# Altium schematic sheet Sensor-Sheet.SchDoc
size A4; SheetNumber: 4; SheetTotal: 5
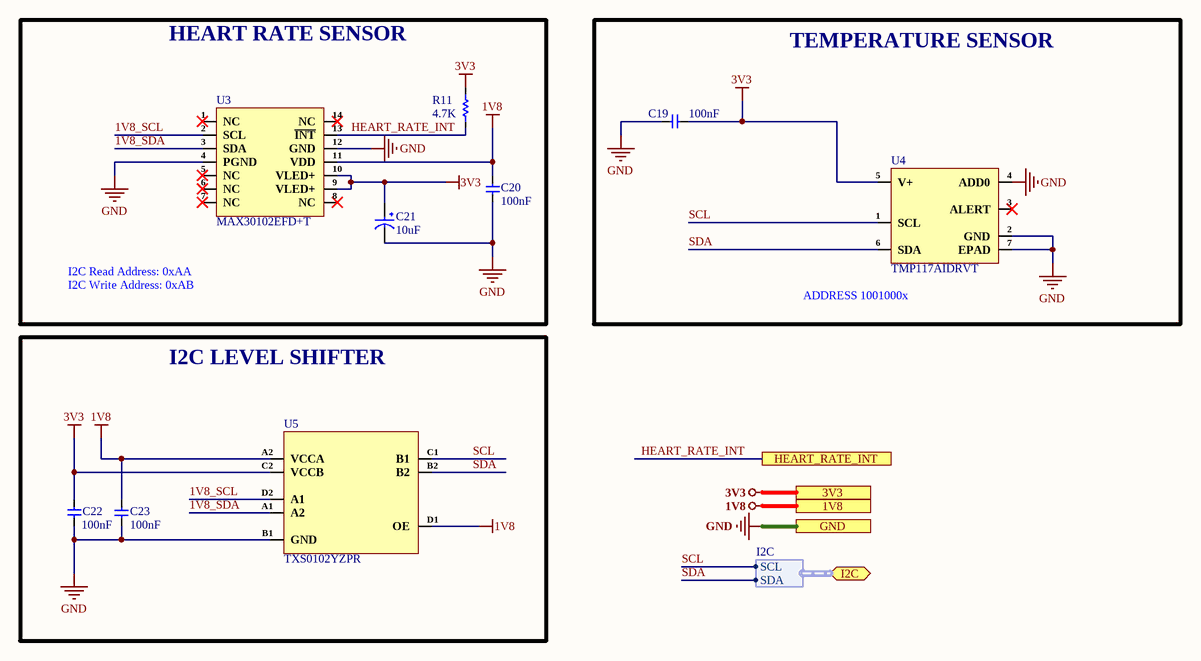
[diagram p0: Sensor-Sheet.SchDoc]

## Parts
C19  100nF  [CAP-0201]
C20  100nF  [CAP-0201]
C21  10uF  [Tant-0603]
C22  100nF  [CAP-0201]
C23  100nF  [CAP-0201]
R11  4.7K  [Res-0201]
U3  MAX30102EFD+T  [MAX30102EFD+T]
U4  TMP117AIDRVT  [WSON-6(2x2)]
U5  TXS0102YZPR  [8-DSBGA]

## Blocks framed on the sheet
HEART RATE SENSOR: C20 C21 R11 U3
TEMPERATURE SENSOR: C19 U4
I2C LEVEL SHIFTER: C22 C23 U5

## Ports
1V8 (see Top-Sheet[3B], Power-Sheet[2D]), 3V3 (see Top-Sheet[3B], Controller-Sheet[3D], Display-Sheet[3D], Power-Sheet[2D]), GND (see Top-Sheet[3B], Controller-Sheet[3D], Display-Sheet[3D], Power-Sheet[2D]), HEART_RATE_INT (see Top-Sheet[3B], Controller-Sheet[3D]), I2C (bidir, harness I2C, see Top-Sheet[3B], Controller-Sheet[1D], Power-Sheet[1D])

## Harnesses
I2C: SCL, SDA

## Nets
1V8: C20.2 C23.2 U3.11(VDD) U5.A2(VCCA) U5.D1(OE) ; port 1V8
3V3: C19.1 C21.1 C22.1 R11.2 U3.9(VLED+) U3.10(VLED+) U4.5(V+) U5.C2(VCCB) ; port 3V3
GND: C19.2 C20.1 C21.2 C22.2 C23.1 U3.4(PGND) U3.12(GND) U4.2(GND) U4.4(ADD0) U4.7(EPAD) U5.B1(GND) ; port GND
1V8_SCL: U3.2(SCL) U5.D2(A1)
1V8_SDA: U3.3(SDA) U5.A1(A2)
HEART_RATE_INT: R11.1 U3.13(~{INT}) ; port HEART_RATE_INT
SCL: U4.1(SCL) U5.C1(B1) ; port I2C.SCL
SDA: U4.6(SDA) U5.B2 ; port I2C.SDA

Not connected (* = marked no-connect by the designer): U3 1(NC)* 5(NC)* 6(NC)* 7(NC)* 8(NC)* 14(NC)*; U4 3(ALERT)*

## Notes on the sheet
- I2C Read Address: 0xAA
  I2C Write Address: 0xAB
- (near U4) ADDRESS 1001000x
- File:
- Title:
- Date:
- Page
- Num:
- Total:
- Drawn By: Huzaifa Ali

## Library data of the parts
C19 C20 C22 C23 = CC0201KRX5R6BB104: CAP CER 0.1UF 10V X5R 0201; Manufacturer: Yageo; Tolerance: 10%; Supplier 1: Mouser; Manufacturer Part Number: CC0201KRX5R6BB104; RoHS: Yes; Category: Ceramic Capacitors; Stock 1: 824403; Pricing 1: 1=0.10000, 10=0.02400, 50=0.02400, 100=0.01900, 1000=0.01100, 10000=0.00900 (USD); Mount: Surface Mount; Case/Package: 0201; Case Code (Imperial): 0201; Case Code (Metric): 0603; Weight: 6E-06oz; Min Operating Temperature: -55°C; Max Operating Temperature: 85°C; Capacitance: 100nF; Dielectric: X5R; Voltage Rating (DC): 10V; Packaging: Tape and Reel; Termination: SMD/SMT; Resistor Type: Ceramic; Voltage Rating: 10V; Series: CC; Construction: Flat; Length: 0.6mm; Width: 0.012inch; Height: 0.3mm; Thickness: 0.013inch; Depth: 0.3mm; Radiation Hardening: No; Lead Free: Lead Free; Halogen Free: Halogen Free; RoHS Compliant: Yes; ComponentLink1URL: https://datasheet.ciiva.com/11587/upy-gphc-x5r-4v-to-50v-12-11587190.pdf?src-supplier=Avnet; ComponentLink1Description: https://datasheet.ciiva.com/11587/upy-gphc-x5r-4v-to-50v-12-11587190.pdf?src-supplier=Avnet; Supplier Part Number 1: 603-CC201KRX5R6BB104; LCSC Part Number: C190183
C21 = T58MM106M6R3C0300: CAP TANT POLY 10UF 6.3V 0603; Manufacturer: Vishay; ESR (Equivalent Series Resistance): 300mR; Tolerance: 20%; Item Type: Capacitor; Supplier: Digi-Key; Supplier Part Number: 718-2111-1-ND; Manufacturer Part Number: T58MM106M6R3C0300; RoHS: Yes; Category: Tantalum Capacitors; Stock: 738; Pricing: 1=0.69, 10=0.462, 50=0.3676, 100=0.3035, 500=0.23714, 1000=0.20158 (USD); Mounting Technology: Surface Mount; Case/Package: 0603; Case Code (Metric): 1608; Case Code (Imperial): 0603; Min Operating Temperature: -55°C; Max Operating Temperature: 105°C; Packaging: Cut Tape; Value: 10uF; Voltage Rating: 6.3V; Voltage Rating (DC): 6.3V; Features: General Purpose; Series: vPolyTan™ T58; Construction: Flat; Length: 1.6mm; Depth: 0.85mm; RoHS Compliant: Yes; Reach SVHC Compliant: Unknown; ComponentLink1URL: http://www.farnell.com/datasheets/2699706.pdf?src-supplier=Farnell; ComponentLink1Description: http://www.farnell.com/datasheets/2699706.pdf?src-supplier=Farnell; ComponentLink2URL: http://www.vishay.com/docs/40189/t58.pdf?src-supplier=Avnet; ComponentLink2Description: http://www.vishay.com/docs/40189/t58.pdf?src-supplier=Avnet; ComponentLink3URL: http://www.farnell.com/datasheets/2028130.pdf?src-supplier=Element14; ComponentLink3Description: http://www.farnell.com/datasheets/2028130.pdf?src-supplier=Element14; ComponentLink4URL: http://www.vishay.com/docs/40189/t58.pdf?src-supplier=Digi-Key; ComponentLink4Description: http://www.vishay.com/docs/40189/t58.pdf?src-supplier=Digi-Key; LCSC Part Number: C2158420
R11 = RC0201FR-074K7L: RES 4.7K OHM 1% 1/20W 0201; Manufacturer: Yageo; Item Type: Resistor; Supplier: Future Electronics; Supplier Part Number: 7537285; Manufacturer Part Number: RC0201FR-074K7L; RoHS: Yes; Category: Chip SMD Resistors; Stock: 1610000; Pricing: 10000=0.0014, 50000=0.0013, 250000=0.0013, 750000=0.0012, 2000000=0.0011 (USD); ComponentLink1URL: https://datasheet.ciiva.com/2493/pyu-r-int-thick-7-2493811.pdf?src-supplier=Digi-Key; ComponentLink1Description: https://datasheet.ciiva.com/2493/pyu-r-int-thick-7-2493811.pdf?src-supplier=Digi-Key; ComponentLink2URL: https://datasheet.ciiva.com/2493/pyu-r-int-thick-7-2493812.pdf?src-supplier=Digi-Key; ComponentLink2Description: https://datasheet.ciiva.com/2493/pyu-r-int-thick-7-2493812.pdf?src-supplier=Digi-Key; ComponentLink3URL: https://datasheet.ciiva.com/2493/pyu-r-int-thick-7-2493813.pdf?src-supplier=Digi-Key; ComponentLink3Description: https://datasheet.ciiva.com/2493/pyu-r-int-thick-7-2493813.pdf?src-supplier=Digi-Key; ComponentLink4URL: https://datasheet.ciiva.com/8892/pyu-rc0201-51-rohs-l-8-8892942.pdf?src-supplier=Avnet; ComponentLink4Description: https://datasheet.ciiva.com/8892/pyu-rc0201-51-rohs-l-8-8892942.pdf?src-supplier=Avnet; ComponentLink5URL: https://datasheet.ciiva.com/7672/1563626-7672233.pdf?src-supplier=Element14; ComponentLink5Description: https://datasheet.ciiva.com/7672/1563626-7672233.pdf?src-supplier=Element14; LCSC Part Number: C138135
U3 = MAX30102EFD+T: SENSOR OXIMETER/HEART RATE I2C; Manufacturer: Maxim; Item Type: Heart Rate Sensor; Supplier: Mouser; Supplier Part Number: 700-MAX30102EFD+T; Manufacturer Part Number: MAX30102EFD+T; RoHS: Yes; Category: Sensors; Stock: 7965; Pricing: 1=12.43, 10=9.84, 50=9.32, 100=7.95, 1000=7.05, 10000=6.66 (USD); Min Operating Temperature: -40°C; Max Operating Temperature: 85°C; Output Type: I2C; Series: -; Packaging: Cut Tape; RoHS Compliant: Yes; ComponentLink1URL: https://datasheets.maximintegrated.com/en/ds/MAX30102.pdf?src-supplier=Digi-Key; ComponentLink1Description: https://datasheets.maximintegrated.com/en/ds/MAX30102.pdf?src-supplier=Digi-Key; LCSC Part Number: C6454833
U4 = TMP117AIDRVT: WSON-6(2x2) Temperature Sensors ROHS; Manufacturer: Texas Instruments; Output Type: I2C; Resolution: 16b; Manufacturer Part Number: TMP117AIDRVT; Package: WSON-6(2x2); LCSC Part Number: C2871850; Item Type: Temperature Sensor; ComponentLink1Description: LCSC; Supplier: Mouser; Supplier Part Number: 595-TMP117AIDRVT; RoHS: Yes; Category: Integrated Circuits (ICs); Stock: 14532; Pricing: 1=6.97, 10=5.24, 50=5.24, 100=4.61, 1000=4.02, 10000=4.02 (USD); Mounting Technology: Surface Mount; Min Operating Temperature: -55°C; Max Operating Temperature: 150°C; Packaging: Cut Tape; Series: -; RoHS Compliant: Yes; ComponentLink2URL: http://www.ti.com/lit/ds/symlink/tmp117.pdf?src-supplier=Digi-Key; ComponentLink2Description: http://www.ti.com/lit/ds/symlink/tmp117.pdf?src-supplier=Digi-Key; ComponentLink3URL: http://www.ti.com/lit/gpn/tmp117?src-supplier=Digi-Key; ComponentLink3Description: http://www.ti.com/lit/gpn/tmp117?src-supplier=Digi-Key
U5 = TXS0102YZPR: IC TRANSLTR BIDIRECTIONAL 8DSBGA; Manufacturer: Texas Instruments; Number of Inputs: 2; Propagation Delay: 260ns; Min Supply Voltage: 1.65V; Max Supply Voltage: 5.5V; Data Rate: 24Mbps; Logic Function: Translator; High Level Output Current: -20uA; Low Level Output Current: 1mA; Turn-On Delay Time: 102ns; Quiescent Current: 14.4uA; Number of Circuits: 1; Rise Time: 165ns; Supplier: Mouser; Supplier Part Number: 595-TXS0102YZPR; Manufacturer Part Number: TXS0102YZPR; RoHS: Yes; Category: Logic ICs; Stock: 48429; Pricing: 1=0.7, 10=0.61, 50=0.61, 100=0.507, 1000=0.402, 10000=0.362 (USD); Mounting Technology: Surface Mount; Case/Package: BGA; Pins: 8; Weight: 8.1E-05oz; Min Operating Temperature: -40°C; Max Operating Temperature: 85°C; Packaging: Tape and Reel; Number of Bits: 2; Series: -; Channel Type: Bidirectional; Output Current: 1mA; Package Quantity: 3000; Length: 1.92mm; Width: 0.918mm; Height: 0.31mm; Radiation Hardening: No; Reach SVHC Compliant: No; Lead Free: Lead Free; RoHS Compliant: Yes; ComponentLink1URL: https://datasheet.ciiva.com/22659/1719892-22659567.pdf?src-supplier=Element14; ComponentLink1Description: https://datasheet.ciiva.com/22659/1719892-22659567.pdf?src-supplier=Element14; ComponentLink2URL: https://datasheet.ciiva.com/1508/1828155-1508731.pdf?src-supplier=Element14; ComponentLink2Description: https://datasheet.ciiva.com/1508/1828155-1508731.pdf?src-supplier=Element14; ComponentLink3URL: https://datasheet.ciiva.com/15096/getdatasheetpartid-376613-15096286.pdf?src-supplier=Verical; ComponentLink3Description: https://datasheet.ciiva.com/15096/getdatasheetpartid-376613-15096286.pdf?src-supplier=Verical; ComponentLink4URL: https://datasheet.ciiva.com/1899/txs0102-1899401.pdf?src-supplier=Digi-Key; ComponentLink4Description: https://datasheet.ciiva.com/1899/txs0102-1899401.pdf?src-supplier=Digi-Key; ComponentLink5URL: https://datasheet.ciiva.com/1899/txs0102-1899402.pdf?src-supplier=Digi-Key; ComponentLink5Description: https://datasheet.ciiva.com/1899/txs0102-1899402.pdf?src-supplier=Digi-Key; ComponentLink6URL: https://datasheet.ciiva.com/1899/txs0102-1899403.pdf?src-supplier=Digi-Key; ComponentLink6Description: https://datasheet.ciiva.com/1899/txs0102-1899403.pdf?src-supplier=Digi-Key; ComponentLink7URL: https://datasheet.ciiva.com/14287/txs0102-14287925.pdf?src-supplier=Avnet; ComponentLink7Description: https://datasheet.ciiva.com/14287/txs0102-14287925.pdf?src-supplier=Avnet; ComponentLink8URL: https://datasheet.ciiva.com/48701/001073841-da-01-en-ic-volt-level-tr-txs0102yzpr-dsbga-8-tid-48701989.pdf?src-supplier=Conrad; ComponentLink8Description: https://datasheet.ciiva.com/48701/001073841-da-01-en-ic-volt-level-tr-txs0102yzpr-dsbga-8-tid-48701989.pdf?src-supplier=Conrad; LCSC Part Number: C353037; Item Type: IC